# Altium schematic sheet A313_6.SchDoc
size 817 x 513 mm
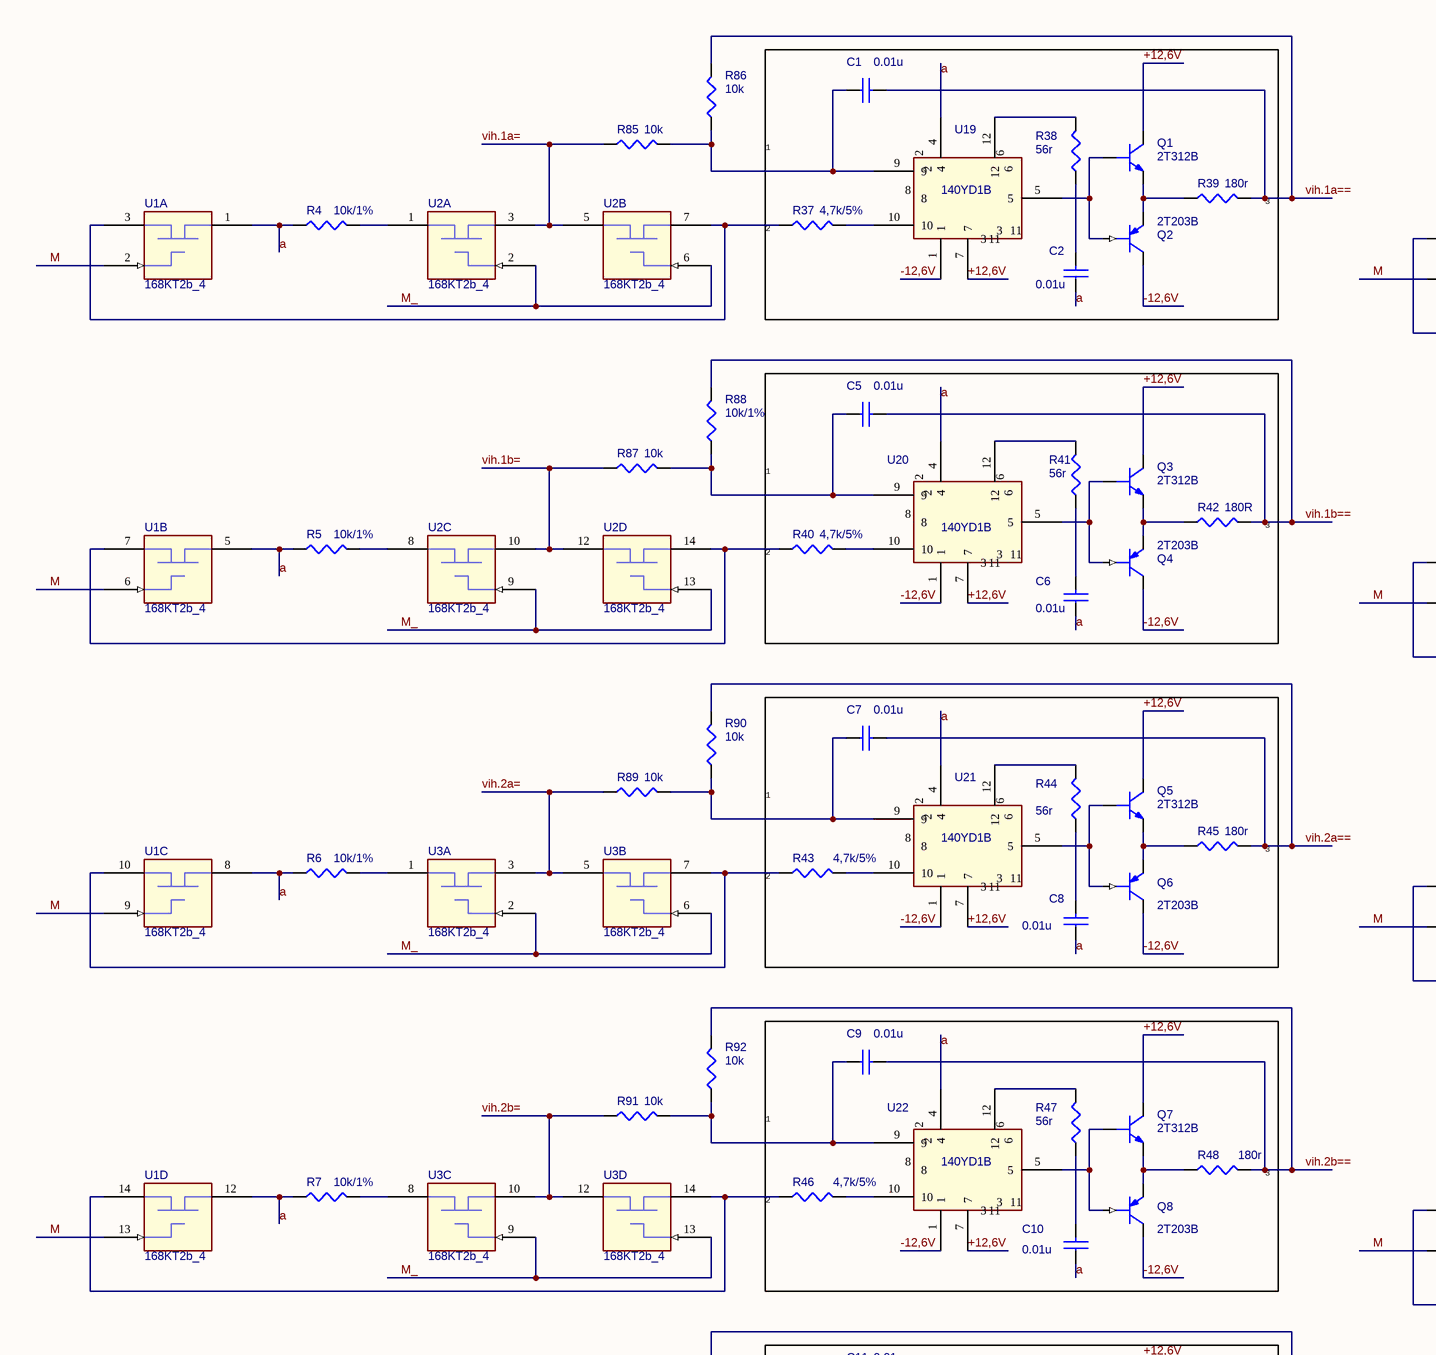
[diagram p0: A313_6.SchDoc, top left]
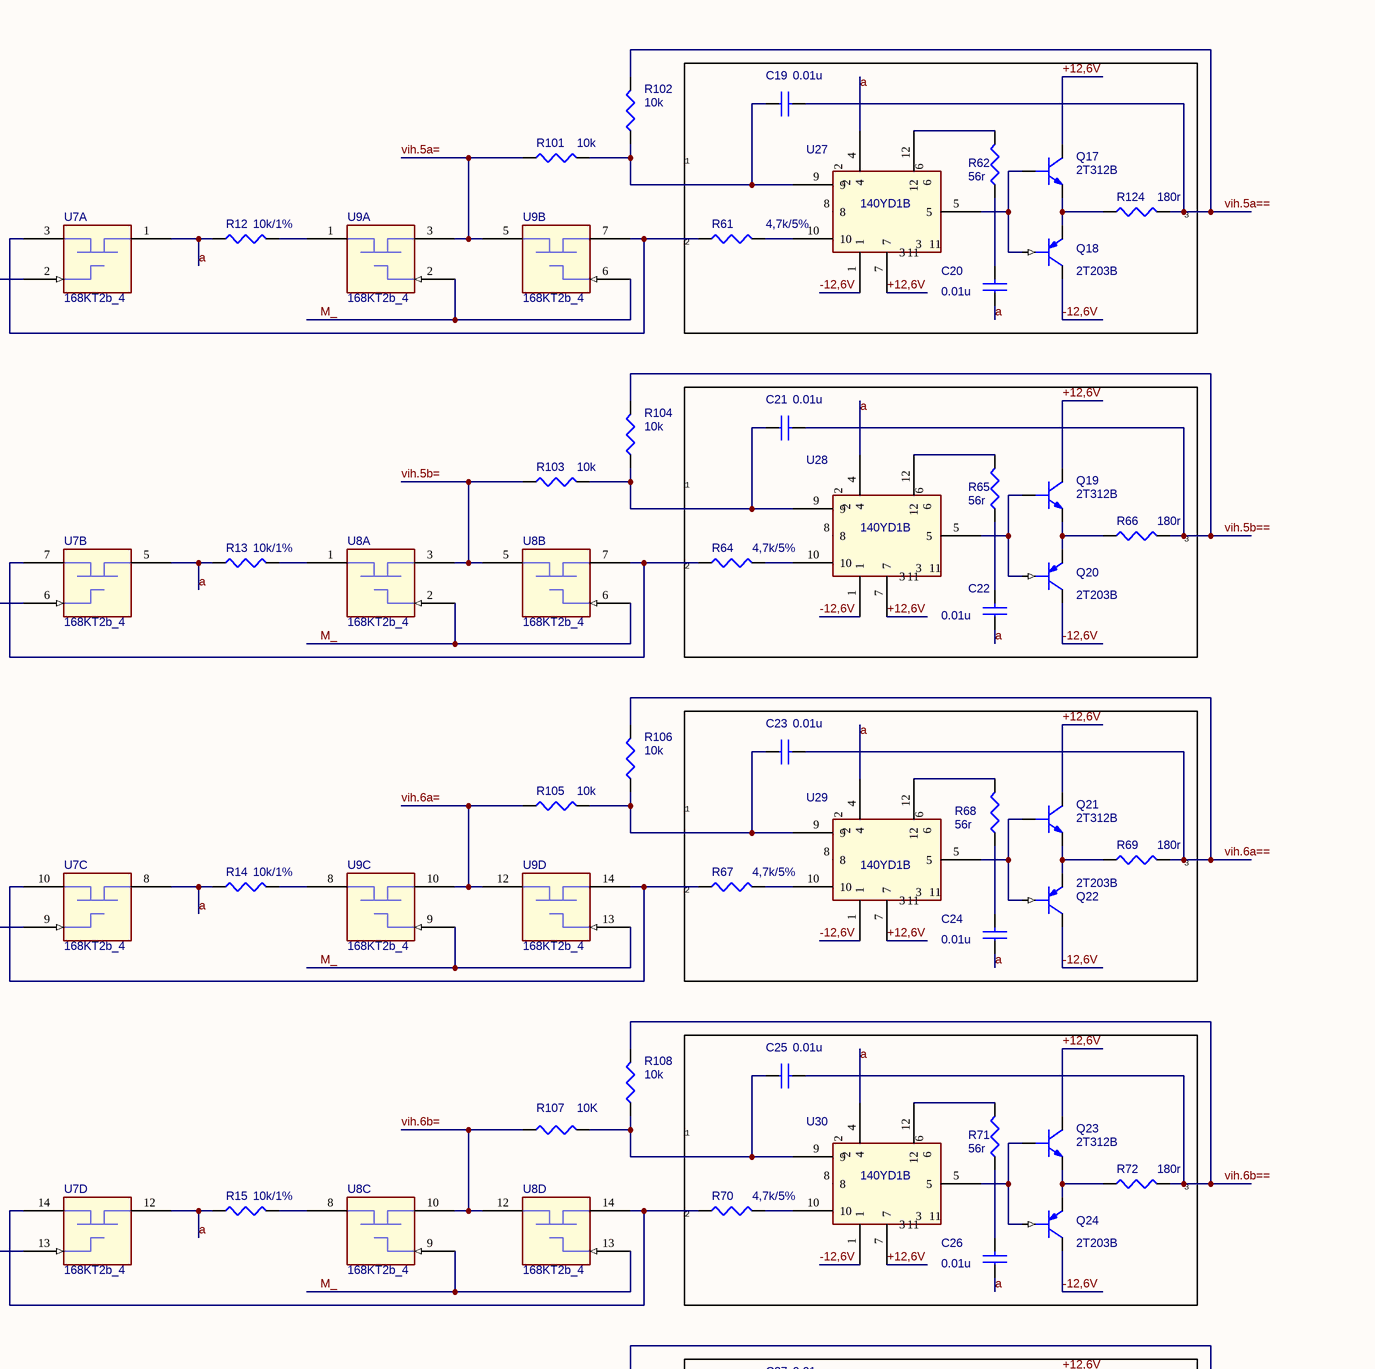
[diagram p1: A313_6.SchDoc, top middle]
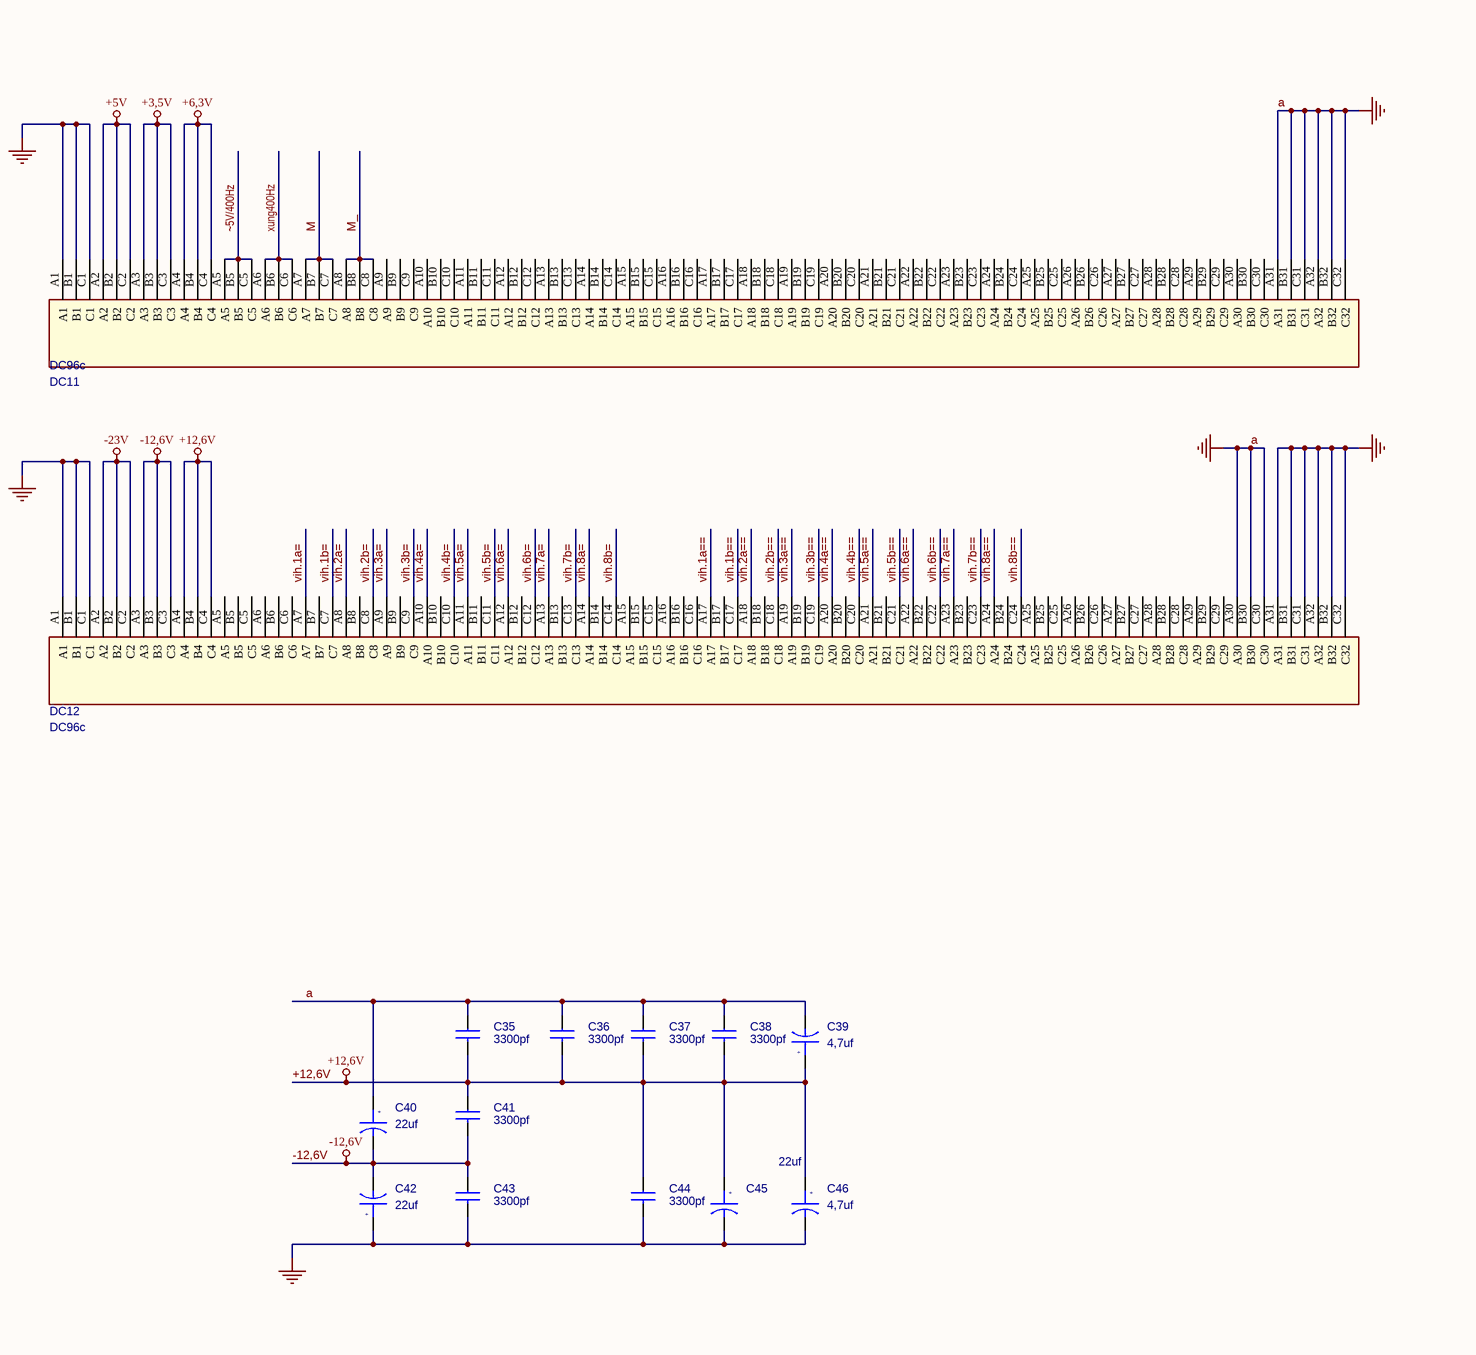
[diagram p2: A313_6.SchDoc, top right]
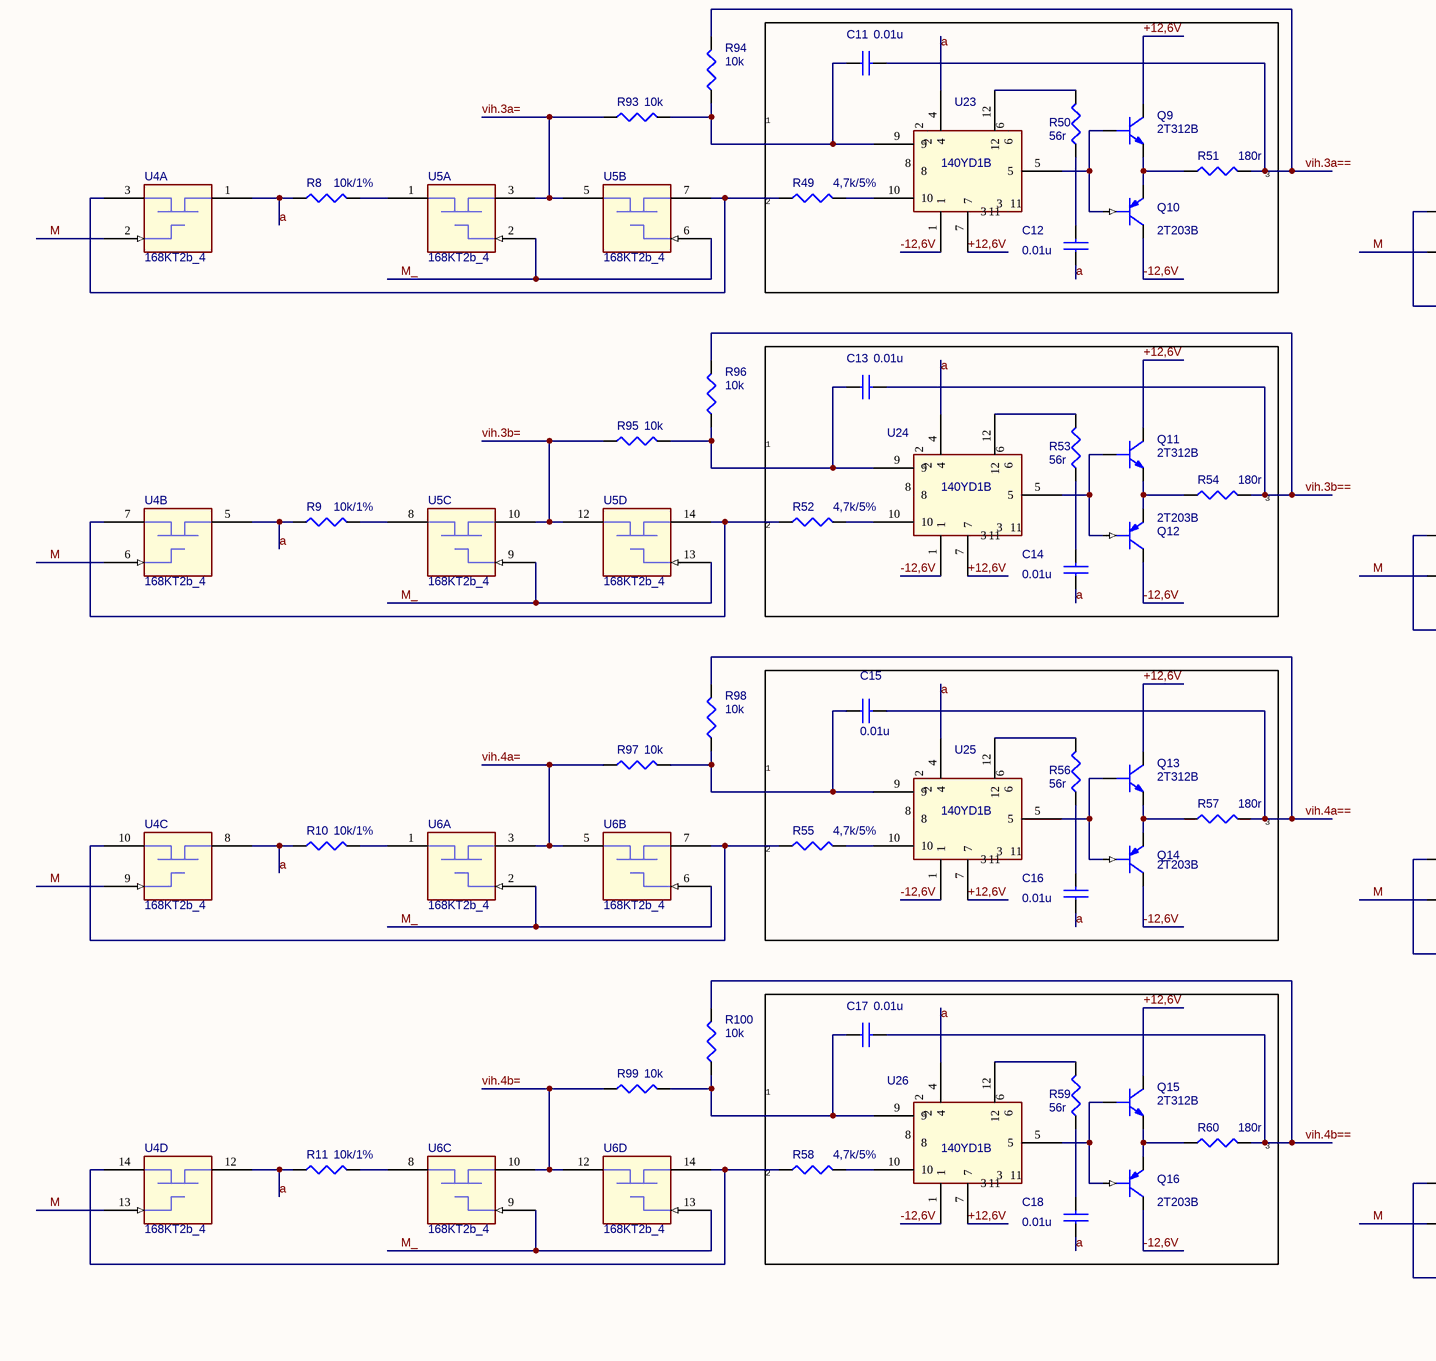
[diagram p3: A313_6.SchDoc, bottom left]
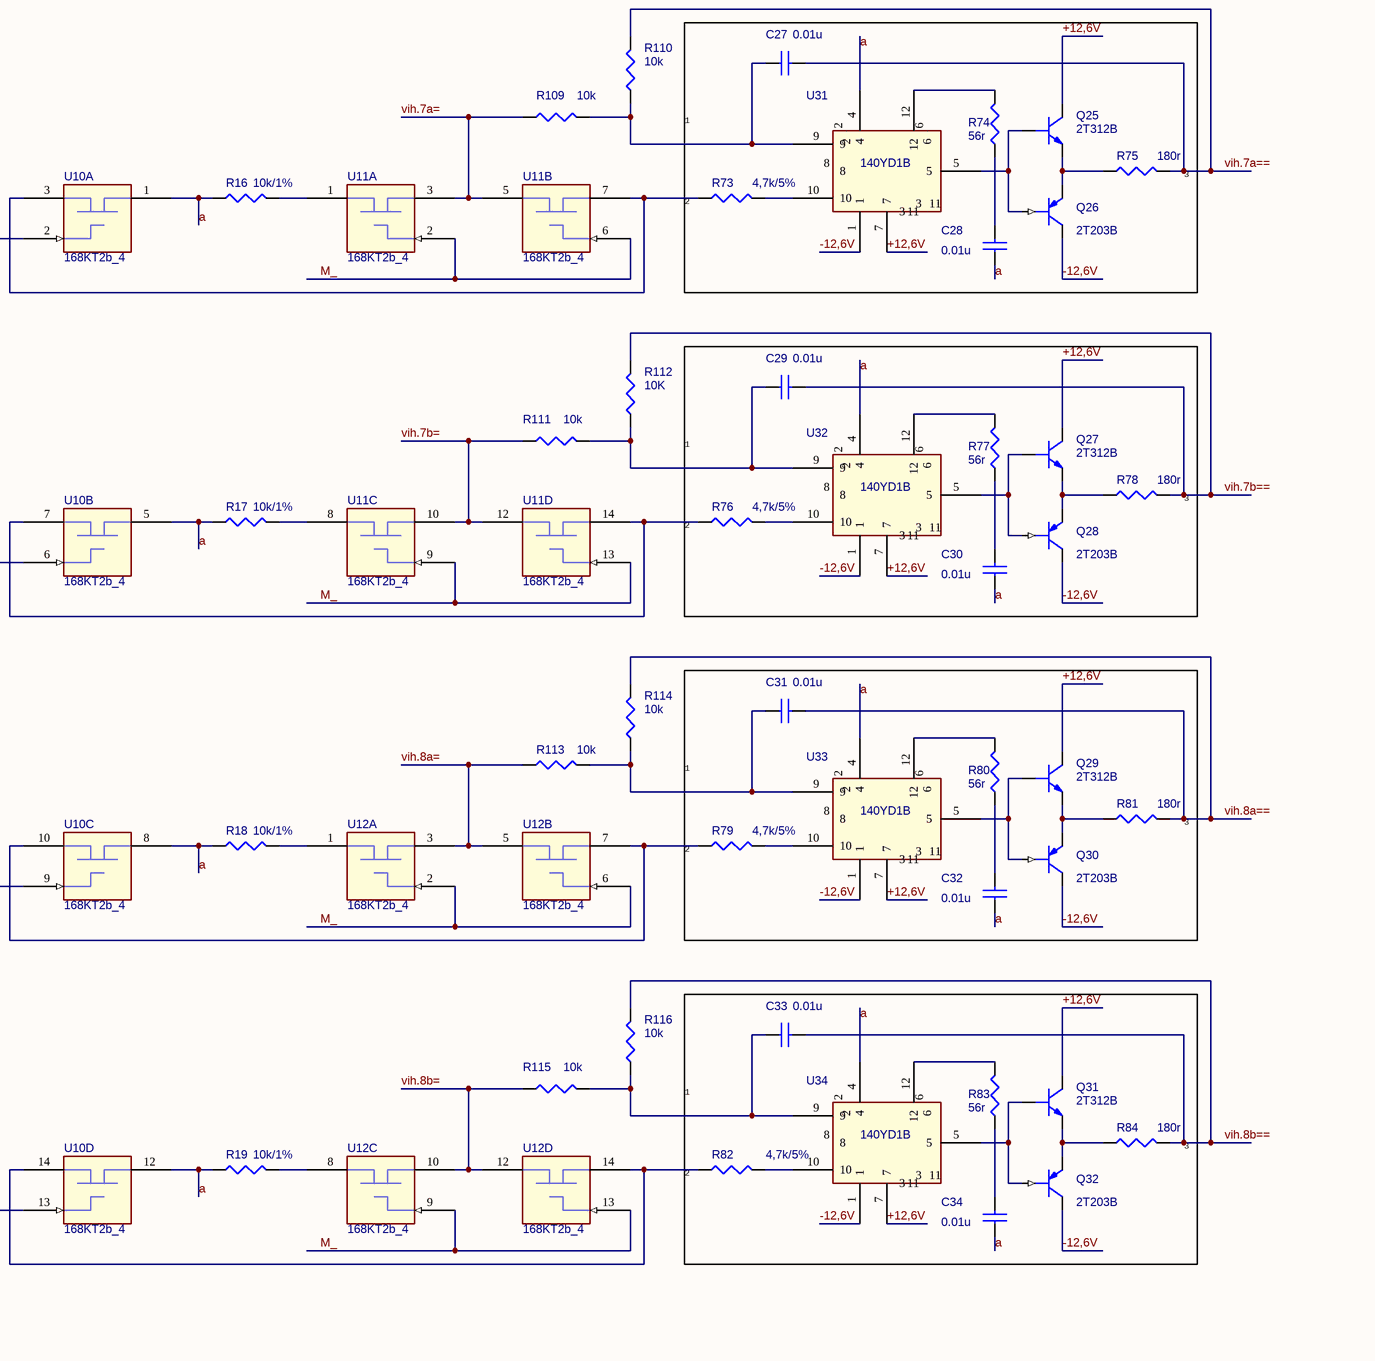
[diagram p4: A313_6.SchDoc, bottom middle]
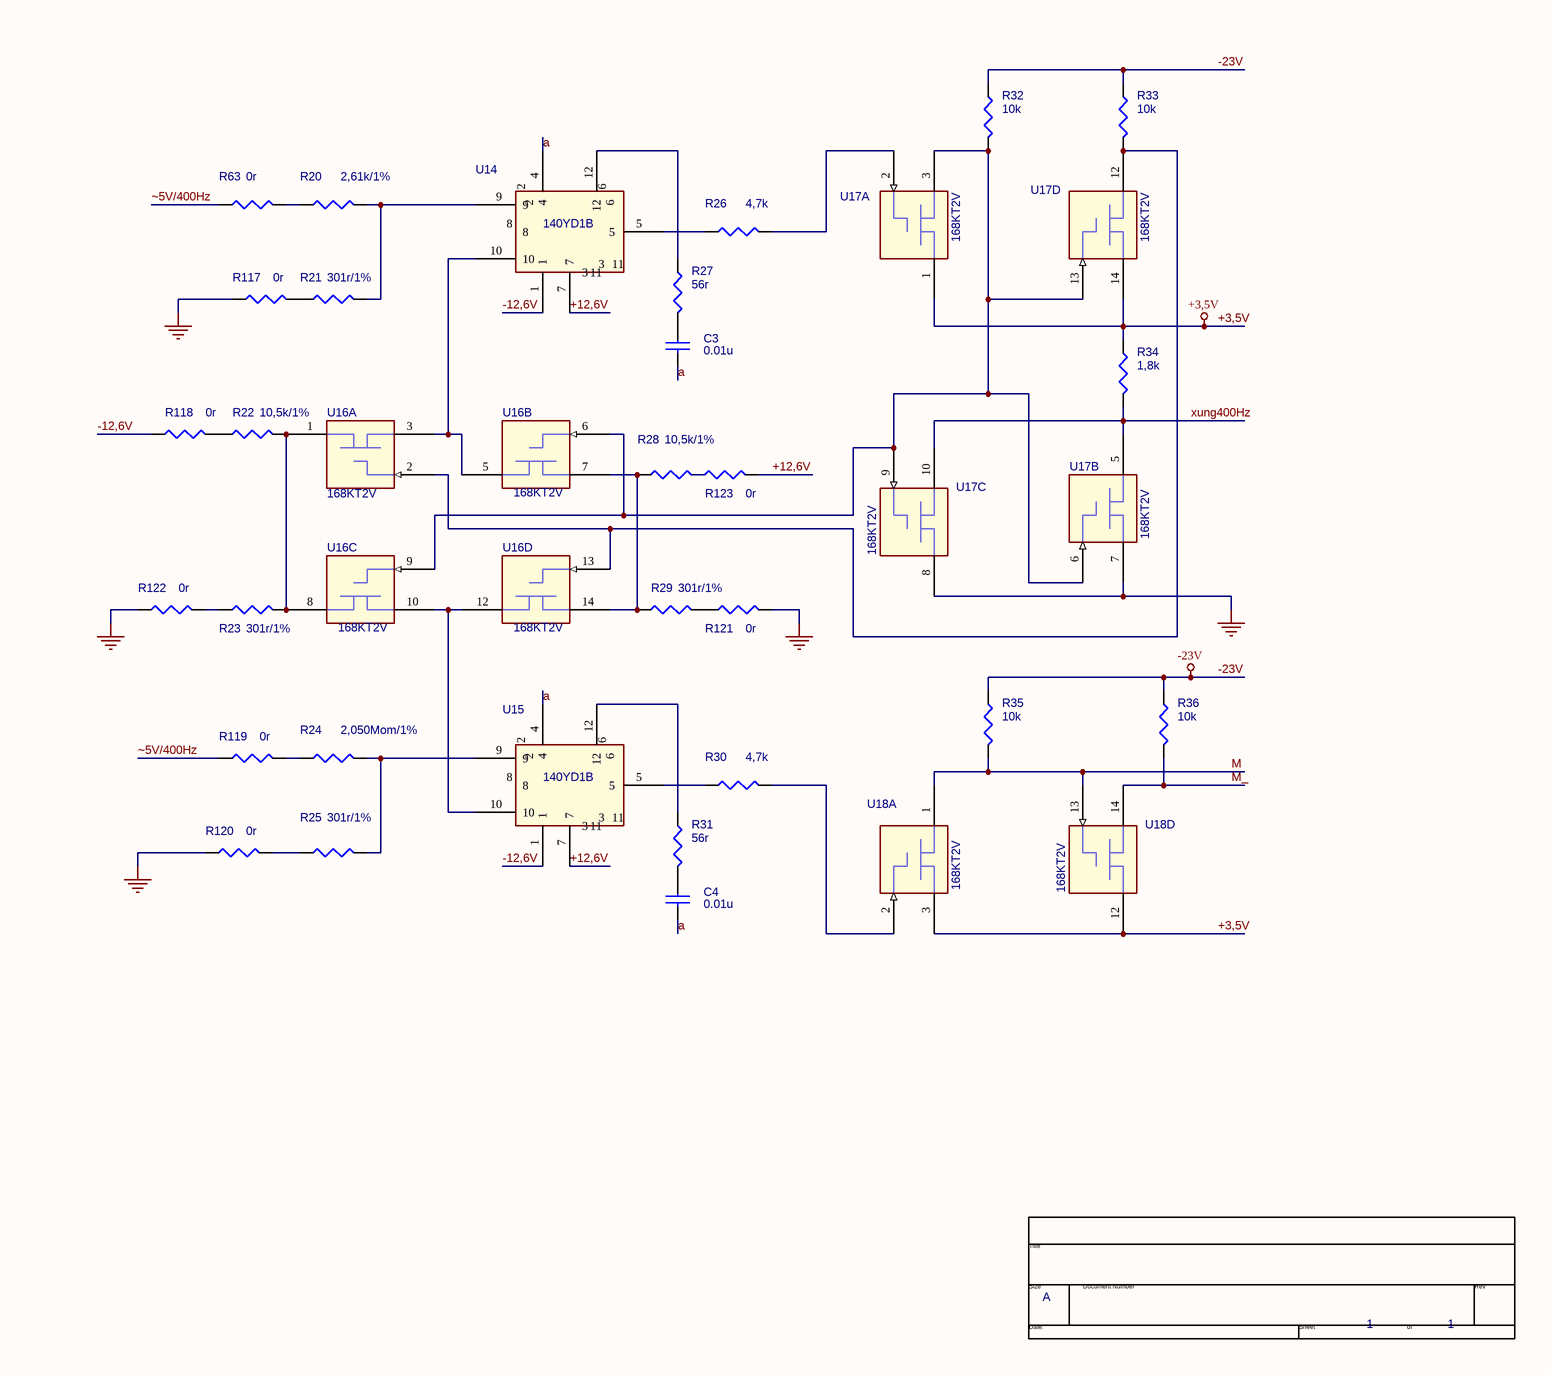
[diagram p5: A313_6.SchDoc, bottom right]

## Parts
(Parts that share a designator on the sheet are numbered #1, #2 ... from top to bottom, then left to right.)
*  Page Size: A  Page Number: 1  (hidden comment: TitleBlock0)  (graphical)
C1  0.01u  [0805]
C2  0.01u  [0805]
C3  0.01u  [0805]
C4  0.01u  [0805]
C5  0.01u  [0805]
C6  0.01u  [0805]
C7  0.01u  [0805]
C8  0.01u  [0805]
C9  0.01u  [0805]
C10  0.01u  [0805]
C11  0.01u  [0805]
C12  0.01u  [0805]
C13  0.01u  [0805]
C14  0.01u  [0805]
C15  0.01u  [0805]
C16  0.01u  [0805]
C17  0.01u  [0805]
C18  0.01u  [0805]
C19  0.01u  [0805]
C20  0.01u  [0805]
C21  0.01u  [0805]
C22  0.01u  [0805]
C23  0.01u  [0805]
C24  0.01u  [0805]
C25  0.01u  [0805]
C26  0.01u  [0805]
C27  0.01u  [0805]
C28  0.01u  [0805]
C29  0.01u  [0805]
C30  0.01u  [0805]
C31  0.01u  [0805]
C32  0.01u  [0805]
C33  0.01u  [0805]
C34  0.01u  [0805]
C35  3300pf  [0805]
C36  3300pf  [0805]
C37  3300pf  [0805]
C38  3300pf  [0805]
C39  4,7uf  [c4,7uf]
C40  22uf  [c22uf]
C41  3300pf  [0805]
C42  22uf  [c22uf]
C43  3300pf  [0805]
C44  3300pf  [0805]
C45  22uf  [c22uf]
C46  4,7uf  [c4,7uf]
DC11  DC96c  [DC96]
DC12  DC96c  [DC96]
Q1  2T312B  [tzt203g]
Q2  2T203B  [tzt203g]
Q3  2T312B  [tzt203g]
Q4  2T203B  [tzt203g]
Q5  2T312B  [tzt203g]
Q6  2T203B  [tzt203g]
Q7  2T312B  [tzt203g]
Q8  2T203B  [tzt203g]
Q9  2T312B  [tzt203g]
Q10  2T203B  [tzt203g]
Q11  2T312B  [tzt203g]
Q12  2T203B  [tzt203g]
Q13  2T312B  [tzt203g]
Q14  2T203B  [tzt203g]
Q15  2T312B  [tzt203g]
Q16  2T203B  [tzt203g]
Q17  2T312B  [tzt203g]
Q18  2T203B  [tzt203g]
Q19  2T312B  [tzt203g]
Q20  2T203B  [tzt203g]
Q21  2T312B  [tzt203g]
Q22  2T203B  [tzt203g]
Q23  2T312B  [tzt203g]
Q24  2T203B  [tzt203g]
Q25  2T312B  [tzt203g]
Q26  2T203B  [tzt203g]
Q27  2T312B  [tzt203g]
Q28  2T203B  [tzt203g]
Q29  2T312B  [tzt203g]
Q30  2T203B  [tzt203g]
Q31  2T312B  [tzt203g]
Q32  2T203B  [tzt203g]
R4  10k/1%  [r0805]
R5  10k/1%  [r0805]
R6  10k/1%  [r0805]
R7  10k/1%  [r0805]
R8  10k/1%  [r0805]
R9  10k/1%  [r0805]
R10  10k/1%  [r0805]
R11  10k/1%  [r0805]
R12  10k/1%  [r0805]
R13  10k/1%  [r0805]
R14  10k/1%  [r0805]
R15  10k/1%  [r0805]
R16  10k/1%  [r0805]
R17  10k/1%  [r0805]
R18  10k/1%  [r0805]
R19  10k/1%  [r0805]
R20  2,61k/1%  [r0805]
R21  301r/1%  [r0805]
R22  10,5k/1%  [r0805]
R23  301r/1%  [r0805]
R24  2,050Mom/1%  [r0805]
R25  301r/1%  [r0805]
R26  4,7k  [r0805]
R27  56r  [r0805]
R28  10,5k/1%  [r0805]
R29  301r/1%  [r0805]
R30  4,7k  [r0805]
R31  56r  [r0805]
R32  10k  [r0805]
R33  10k  [r0805]
R34  1,8k  [r0805]
R35  10k  [r0805]
R36  10k  [r0805]
R37  4,7k/5%  [r0805]
R38  56r  [r0805]
R39  180r  [r0805]
R40  4,7k/5%  [r0805]
R41  56r  [r0805]
R42  180R  [r0805]
R43  4,7k/5%  [r0805]
R44  56r  [r0805]
R45  180r  [r0805]
R46  4,7k/5%  [r0805]
R47  56r  [r0805]
R48  180r  [r0805]
R49  4,7k/5%  [r0805]
R50  56r  [r0805]
R51  180r  [r0805]
R52  4,7k/5%  [r0805]
R53  56r  [r0805]
R54  180r  [r0805]
R55  4,7k/5%  [r0805]
R56  56r  [r0805]
R57  180r  [r0805]
R58  4,7k/5%  [r0805]
R59  56r  [r0805]
R60  180r  [r0805]
R61  4,7k/5%  [r0805]
R62  56r  [r0805]
R63  0r  [r0805]
R64  4,7k/5%  [r0805]
R65  56r  [r0805]
R66  180r  [r0805]
R67  4,7k/5%  [r0805]
R68  56r  [r0805]
R69  180r  [r0805]
R70  4,7k/5%  [r0805]
R71  56r  [r0805]
R72  180r  [r0805]
R73  4,7k/5%  [r0805]
R74  56r  [r0805]
R75  180r  [r0805]
R76  4,7k/5%  [r0805]
R77  56r  [r0805]
R78  180r  [r0805]
R79  4,7k/5%  [r0805]
R80  56r  [r0805]
R81  180r  [r0805]
R82  4,7k/5%  [r0805]
R83  56r  [r0805]
R84  180r  [r0805]
R85  10k  [r0805]
R86  10k  [r0805]
R87  10k  [r0805]
R88  10k/1%  [r0805]
R89  10k  [r0805]
R90  10k  [r0805]
R91  10k  [r0805]
R92  10k  [r0805]
R93  10k  [r0805]
R94  10k  [r0805]
R95  10k  [r0805]
R96  10k  [r0805]
R97  10k  [r0805]
R98  10k  [r0805]
R99  10k  [r0805]
R100  10k  [r0805]
R101  10k  [r0805]
R102  10k  [r0805]
R103  10k  [r0805]
R104  10k  [r0805]
R105  10k  [r0805]
R106  10k  [r0805]
R107  10K  [r0805]
R108  10k  [r0805]
R109  10k  [r0805]
R110  10k  [r0805]
R111  10k  [r0805]
R112  10K  [r0805]
R113  10k  [r0805]
R114  10k  [r0805]
R115  10k  [r0805]
R116  10k  [r0805]
R117  0r  [r0805]
R118  0r  [r0805]
R119  0r  [r0805]
R120  0r  [r0805]
R121  0r  [r0805]
R122  0r  [r0805]
R123  0r  [r0805]
R124  180r  [r0805]
U1#1  168KT2b_4  [168KT2B-1]  (part A of 4)
U1#2  168KT2b_4  [168KT2B-1]  (parts B,C,D of 4)
U2#1  168KT2b_4  [168KT2B-1]  (part A of 4)
U2#2  168KT2b_4  [168KT2B-1]  (parts B,C,D of 4)
U3  168KT2b_4  [168KT2B-1]  (parts A,B,C,D of 4)
U4  168KT2b_4  [168KT2B-1]  (parts A,B,C,D of 4)
U5  168KT2b_4  [168KT2B-1]  (parts A,B,C,D of 4)
U6  168KT2b_4  [168KT2B-1]  (parts A,B,C,D of 4)
U7  168KT2b_4  [168KT2B-1]  (parts A,B,C,D of 4)
U8#1  168KT2b_4  [168KT2B-1]  (parts A,B,D of 4)
U8#2  168KT2b_4  [168KT2B-1]  (part C of 4)
U9  168KT2b_4  [168KT2B-1]  (parts A,B,C,D of 4)
U10  168KT2b_4  [168KT2B-1]  (parts A,B,C,D of 4)
U11  168KT2b_4  [168KT2B-1]  (parts A,B,C,D of 4)
U12#1  168KT2b_4  [168KT2B-1]  (part A of 4)
U12#2  168KT2b_4  [168KT2B-1]  (parts B,C,D of 4)
U14  140YD1B  [140YD]
U15  140YD1B  [140YD]
U16#1  168KT2V  [168KT2B-1]  (part B of 4)
U16#2  168KT2V  [168KT2B-1]  (part A of 4)
U16#3  168KT2V  [168KT2B-1]  (parts C,D of 4)
U17#1  168KT2V  [168KT2B-1]  (parts A,B,D of 4)
U17#2  168KT2V  [168KT2B-1]  (part C of 4)
U18  168KT2V  [168KT2B-1]  (parts A,D of 4)
U19  140YD1B  [140YD]
U20  140YD1B  [140YD]
U21  140YD1B  [140YD]
U22  140YD1B  [140YD]
U23  140YD1B  [140YD]
U24  140YD1B  [140YD]
U25  140YD1B  [140YD]
U26  140YD1B  [140YD]
U27  140YD1B  [140YD]
U28  140YD1B  [140YD]
U29  140YD1B  [140YD]
U30  140YD1B  [140YD]
U31  140YD1B  [140YD]
U32  140YD1B  [140YD]
U33  140YD1B  [140YD]
U34  140YD1B  [140YD]

## Nets
+3,5V: DC11.A3 DC11.B3 DC11.C3 R34.1 U16#1.11(+3,5V) U16#2.11(+3,5V) U16#3.11(+3,5V) U17#1.1(A) U17#1.11(+3,5V) U17#1.14(B) U17#2.11(+3,5V) U18.3(B) U18.11(+3,5V) U18.12(A)
+5V: DC11.A2 DC11.B2 DC11.C2
+6,3V: DC11.A4 DC11.B4 DC11.C4 U1#1.11(+6,3V) U1#2.11(+6,3V) U2#1.11(+6,3V) U2#2.11(+6,3V) U3.11(+6,3V) U4.11(+6,3V) U5.11(+6,3V) U6.11(+6,3V) U7.11(+6,3V) U8#1.11(+6,3V) U8#2.11(+6,3V) U9.11(+6,3V) U10.11(+6,3V) U11.11(+6,3V) U12#1.11(+6,3V) U12#2.11(+6,3V)
+12,6V: C35.2 C36.2 C37.2 C38.2 C39.1 C41.1 C44.1 C45.1 C46.1 DC12.A4 DC12.B4 DC12.C4 Q1.2(C) Q3.2(C) Q5.2(C) Q7.2(C) Q9.2(C) Q11.2(C) Q13.2(C) Q15.2(C) Q17.2(C) Q19.2(C) Q21.2(C) Q23.2(C) Q25.2(C) Q27.2(C) Q29.2(C) Q31.2(C) R123.2 U14.7 U15.7 U19.7 U20.7 U21.7 U22.7 U23.7 U24.7 U25.7 U26.7 U27.7 U28.7 U29.7 U30.7 U31.7 U32.7 U33.7 U34.7
-12,6V: C40.2 C41.2 C42.2 C43.1 DC12.A3 DC12.B3 DC12.C3 Q2.3(COLLECTOR) Q4.3(COLLECTOR) Q6.3(COLLECTOR) Q8.3(COLLECTOR) Q10.3(COLLECTOR) Q12.3(COLLECTOR) Q14.3(COLLECTOR) Q16.3(COLLECTOR) Q18.3(COLLECTOR) Q20.3(COLLECTOR) Q22.3(COLLECTOR) Q24.3(COLLECTOR) Q26.3(COLLECTOR) Q28.3(COLLECTOR) Q30.3(COLLECTOR) Q32.3(COLLECTOR) R118.1 U14.1 U15.1 U19.1 U20.1 U21.1 U22.1 U23.1 U24.1 U25.1 U26.1 U27.1 U28.1 U29.1 U30.1 U31.1 U32.1 U33.1 U34.1
-23V: DC12.A2 DC12.B2 DC12.C2 R32.1 R33.1 R35.1 R36.1
a: C2.1 C3.2 C4.2 C6.1 C8.1 C10.1 C12.1 C14.1 C16.1 C18.1 C20.1 C22.1 C24.1 C26.1 C28.1 C30.1 C32.1 C34.1 C35.1 C36.1 C37.1 C38.1 C39.2 C40.1 C42.1 C43.2 C44.2 C45.2 C46.2 DC11.A1 DC11.A31 DC11.A32 DC11.B1 DC11.B31 DC11.B32 DC11.C1 DC11.C31 DC11.C32 DC12.A1 DC12.A30 DC12.A31 DC12.A32 DC12.B1 DC12.B30 DC12.B31 DC12.B32 DC12.C1 DC12.C30 DC12.C31 DC12.C32 R4.1 R5.1 R6.1 R7.1 R8.1 R9.1 R10.1 R11.1 R12.1 R13.1 R14.1 R15.1 R16.1 R17.1 R18.1 R19.1 R117.1 R120.1 R121.2 R122.1 U1#1.1(A) U1#2.5(A) U1#2.8(A) U1#2.12(A) U4.1(A) U4.5(A) U4.8(A) U4.12(A) U7.1(A) U7.5(A) U7.8(A) U7.12(A) U10.1(A) U10.5(A) U10.8(A) U10.12(A) U14.4 U15.4 U17#1.7(B) U17#2.8(A) U19.4 U20.4 U21.4 U22.4 U23.4 U24.4 U25.4 U26.4 U27.4 U28.4 U29.4 U30.4 U31.4 U32.4 U33.4 U34.4  [also labelled GND]
M: DC11.A7 DC11.B7 DC11.C7 R35.2 U1#1.2(C) U1#2.6(C) U1#2.9(C) U1#2.13(C) U4.2(C) U4.6(C) U4.9(C) U4.13(C) U7.2(C) U7.6(C) U7.9(C) U7.13(C) U10.2(C) U10.6(C) U10.9(C) U10.13(C) U18.1(A) U18.13(C)
M_: DC11.A8 DC11.B8 DC11.C8 R36.2 U2#1.2(C) U2#2.6(C) U2#2.9(C) U2#2.13(C) U3.2(C) U3.6(C) U3.9(C) U3.13(C) U5.2(C) U5.6(C) U5.9(C) U5.13(C) U6.2(C) U6.6(C) U6.9(C) U6.13(C) U8#1.2(C) U8#1.6(C) U8#1.13(C) U8#2.9(C) U9.2(C) U9.6(C) U9.9(C) U9.13(C) U11.2(C) U11.6(C) U11.9(C) U11.13(C) U12#1.2(C) U12#2.6(C) U12#2.9(C) U12#2.13(C) U18.14(B)
vih.1a=: DC12.A7 R85.1 U2#1.3(B) U2#2.5(A)
vih.1a==: C1.2 DC12.A17 R39.2 R86.2
vih.1b=: DC12.C7 R87.1 U2#2.10(B) U2#2.12(A)
vih.1b==: C5.2 DC12.C17 R42.2 R88.2
vih.2a=: DC12.A8 R89.1 U3.3(B) U3.5(A)
vih.2a==: C7.2 DC12.A18 R45.2 R90.2
vih.2b=: DC12.C8 R91.1 U3.10(B) U3.12(A)
vih.2b==: C9.2 DC12.C18 R48.2 R92.2
vih.3a=: DC12.A9 R93.1 U5.3(B) U5.5(A)
vih.3a==: C11.2 DC12.A19 R51.2 R94.2
vih.3b=: DC12.C9 R95.1 U5.10(B) U5.12(A)
vih.3b==: C13.2 DC12.C19 R54.2 R96.2
vih.4a=: DC12.A10 R97.1 U6.3(B) U6.5(A)
vih.4a==: C15.2 DC12.A20 R57.2 R98.2
vih.4b=: DC12.C10 R99.1 U6.10(B) U6.12(A)
vih.4b==: C17.2 DC12.C20 R60.2 R100.2
vih.5a=: DC12.A11 R101.1 U9.3(B) U9.5(A)
vih.5a==: C19.2 DC12.A21 R102.2 R124.2
vih.5b=: DC12.C11 R103.1 U8#1.3(B) U8#1.5(A)
vih.5b==: C21.2 DC12.C21 R66.2 R104.2
vih.6a=: DC12.A12 R105.1 U9.10(B) U9.12(A)
vih.6a==: C23.2 DC12.A22 R69.2 R106.2
vih.6b=: DC12.C12 R107.1 U8#1.12(A) U8#2.10(B)
vih.6b==: C25.2 DC12.C22 R72.2 R108.2
vih.7a=: DC12.A13 R109.1 U11.3(B) U11.5(A)
vih.7a==: C27.2 DC12.A23 R75.2 R110.2
vih.7b=: DC12.C13 R111.1 U11.10(B) U11.12(A)
vih.7b==: C29.2 DC12.C23 R78.2 R112.2
vih.8a=: DC12.A14 R113.1 U12#1.3(B) U12#2.5(A)
vih.8a==: C31.2 DC12.A24 R81.2 R114.2
vih.8b=: DC12.C14 R115.1 U12#2.10(B) U12#2.12(A)
vih.8b==: C33.2 DC12.C24 R84.2 R116.2
xung400Hz: DC11.A6 DC11.B6 DC11.C6 R34.2 U17#1.5(A) U17#2.10(B)
~5V/400Hz: DC11.A5 DC11.B5 DC11.C5 R63.1 R119.1
NetC1_1: C1.1 R85.2 R86.1 U19.9
NetC2_2: C2.2 R38.1
NetC3_1: C3.1 R27.2
NetC4_1: C4.1 R31.2
NetC5_1: C5.1 R87.2 R88.1 U20.9
NetC6_2: C6.2 R41.1
NetC7_1: C7.1 R89.2 R90.1 U21.9
NetC8_2: C8.2 R44.1
NetC9_1: C9.1 R91.2 R92.1 U22.9
NetC10_2: C10.2 R47.1
NetC11_1: C11.1 R93.2 R94.1 U23.9
NetC12_2: C12.2 R50.1
NetC13_1: C13.1 R95.2 R96.1 U24.9
NetC14_2: C14.2 R53.1
NetC15_1: C15.1 R97.2 R98.1 U25.9
NetC16_2: C16.2 R56.1
NetC17_1: C17.1 R99.2 R100.1 U26.9
NetC18_2: C18.2 R59.1
NetC19_1: C19.1 R101.2 R102.1 U27.9
NetC20_2: C20.2 R62.1
NetC21_1: C21.1 R103.2 R104.1 U28.9
NetC22_2: C22.2 R65.1
NetC23_1: C23.1 R105.2 R106.1 U29.9
NetC24_2: C24.2 R68.1
NetC25_1: C25.1 R107.2 R108.1 U30.9
NetC26_2: C26.2 R71.1
NetC27_1: C27.1 R109.2 R110.1 U31.9
NetC28_2: C28.2 R74.1
NetC29_1: C29.1 R111.2 R112.1 U32.9
NetC30_2: C30.2 R77.1
NetC31_1: C31.1 R113.2 R114.1 U33.9
NetC32_2: C32.2 R80.1
NetC33_1: C33.1 R115.2 R116.1 U34.9
NetC34_2: C34.2 R83.1
NetQ1_1: Q1.1(B) Q2.2(BASE) U19.5
NetQ1_3: Q1.3(E) Q2.1(EMITTER) R39.1
NetQ3_1: Q3.1(B) Q4.2(BASE) U20.5
NetQ3_3: Q3.3(E) Q4.1(EMITTER) R42.1
NetQ5_1: Q5.1(B) Q6.2(BASE) U21.5
NetQ5_3: Q5.3(E) Q6.1(EMITTER) R45.1
NetQ7_1: Q7.1(B) Q8.2(BASE) U22.5
NetQ7_3: Q7.3(E) Q8.1(EMITTER) R48.1
NetQ9_1: Q9.1(B) Q10.2(BASE) U23.5
NetQ9_3: Q9.3(E) Q10.1(EMITTER) R51.1
NetQ11_1: Q11.1(B) Q12.2(BASE) U24.5
NetQ11_3: Q11.3(E) Q12.1(EMITTER) R54.1
NetQ13_1: Q13.1(B) Q14.2(BASE) U25.5
NetQ13_3: Q13.3(E) Q14.1(EMITTER) R57.1
NetQ15_1: Q15.1(B) Q16.2(BASE) U26.5
NetQ15_3: Q15.3(E) Q16.1(EMITTER) R60.1
NetQ17_1: Q17.1(B) Q18.2(BASE) U27.5
NetQ17_3: Q17.3(E) Q18.1(EMITTER) R124.1
NetQ19_1: Q19.1(B) Q20.2(BASE) U28.5
NetQ19_3: Q19.3(E) Q20.1(EMITTER) R66.1
NetQ21_1: Q21.1(B) Q22.2(BASE) U29.5
NetQ21_3: Q21.3(E) Q22.1(EMITTER) R69.1
NetQ23_1: Q23.1(B) Q24.2(BASE) U30.5
NetQ23_3: Q23.3(E) Q24.1(EMITTER) R72.1
NetQ25_1: Q25.1(B) Q26.2(BASE) U31.5
NetQ25_3: Q25.3(E) Q26.1(EMITTER) R75.1
NetQ27_1: Q27.1(B) Q28.2(BASE) U32.5
NetQ27_3: Q27.3(E) Q28.1(EMITTER) R78.1
NetQ29_1: Q29.1(B) Q30.2(BASE) U33.5
NetQ29_3: Q29.3(E) Q30.1(EMITTER) R81.1
NetQ31_1: Q31.1(B) Q32.2(BASE) U34.5
NetQ31_3: Q31.3(E) Q32.1(EMITTER) R84.1
NetR4_2: R4.2 U2#1.1(A)
NetR5_2: R5.2 U2#2.8(A)
NetR6_2: R6.2 U3.1(A)
NetR7_2: R7.2 U3.8(A)
NetR8_2: R8.2 U5.1(A)
NetR9_2: R9.2 U5.8(A)
NetR10_2: R10.2 U6.1(A)
NetR11_2: R11.2 U6.8(A)
NetR12_2: R12.2 U9.1(A)
NetR13_2: R13.2 U8#1.1(A)
NetR14_2: R14.2 U9.8(A)
NetR15_2: R15.2 U8#2.8(A)
NetR16_2: R16.2 U11.1(A)
NetR17_2: R17.2 U11.8(A)
NetR18_2: R18.2 U12#1.1(A)
NetR19_2: R19.2 U12#2.8(A)
NetR20_1: R20.1 R63.2
NetR20_2: R20.2 R21.2 U14.9
NetR21_1: R21.1 R117.2
NetR22_1: R22.1 R118.2
NetR22_2: R22.2 R23.2 U16#2.1(A) U16#3.8(A)
NetR23_1: R23.1 R122.2
NetR24_1: R24.1 R119.2
NetR24_2: R24.2 R25.2 U15.9
NetR25_1: R25.1 R120.2
NetR26_1: R26.1 U14.5
NetR26_2: R26.2 U17#1.2(C)
NetR27_1: R27.1 U14.12
NetR28_1: R28.1 R29.1 U16#1.7(B) U16#3.14(B)
NetR28_2: R28.2 R123.1
NetR29_2: R29.2 R121.1
NetR30_1: R30.1 U15.5
NetR30_2: R30.2 U18.2(C)
NetR31_1: R31.1 U15.12
NetR32_2: R32.2 U16#1.6(C) U16#3.9(C) U17#1.3(B) U17#1.6(C) U17#1.13(C) U17#2.9(C)
NetR33_2: R33.2 U16#2.2(C) U16#3.13(C) U17#1.12(A)
NetR37_1: R37.1 U1#1.3(B) U2#2.7(B)
NetR37_2: R37.2 U19.10
NetR38_2: R38.2 U19.12
NetR40_1: R40.1 U1#2.7(B) U2#2.14(B)
NetR40_2: R40.2 U20.10
NetR41_2: R41.2 U20.12
NetR43_1: R43.1 U1#2.10(B) U3.7(B)
NetR43_2: R43.2 U21.10
NetR44_2: R44.2 U21.12
NetR46_1: R46.1 U1#2.14(B) U3.14(B)
NetR46_2: R46.2 U22.10
NetR47_2: R47.2 U22.12
NetR49_1: R49.1 U4.3(B) U5.7(B)
NetR49_2: R49.2 U23.10
NetR50_2: R50.2 U23.12
NetR52_1: R52.1 U4.7(B) U5.14(B)
NetR52_2: R52.2 U24.10
NetR53_2: R53.2 U24.12
NetR55_1: R55.1 U4.10(B) U6.7(B)
NetR55_2: R55.2 U25.10
NetR56_2: R56.2 U25.12
NetR58_1: R58.1 U4.14(B) U6.14(B)
NetR58_2: R58.2 U26.10
NetR59_2: R59.2 U26.12
NetR61_1: R61.1 U7.3(B) U9.7(B)
NetR61_2: R61.2 U27.10
NetR62_2: R62.2 U27.12
NetR64_1: R64.1 U7.7(B) U8#1.7(B)
NetR64_2: R64.2 U28.10
NetR65_2: R65.2 U28.12
NetR67_1: R67.1 U7.10(B) U9.14(B)
NetR67_2: R67.2 U29.10
NetR68_2: R68.2 U29.12
NetR70_1: R70.1 U7.14(B) U8#1.14(B)
NetR70_2: R70.2 U30.10
NetR71_2: R71.2 U30.12
NetR73_1: R73.1 U10.3(B) U11.7(B)
NetR73_2: R73.2 U31.10
NetR74_2: R74.2 U31.12
NetR76_1: R76.1 U10.7(B) U11.14(B)
NetR76_2: R76.2 U32.10
NetR77_2: R77.2 U32.12
NetR79_1: R79.1 U10.10(B) U12#2.7(B)
NetR79_2: R79.2 U33.10
NetR80_2: R80.2 U33.12
NetR82_1: R82.1 U10.14(B) U12#2.14(B)
NetR82_2: R82.2 U34.10
NetR83_2: R83.2 U34.12
NetU14_10: U14.10 U16#1.5(A) U16#2.3(B)
NetU15_10: U15.10 U16#3.10(B) U16#3.12(A)

Not connected (* = marked no-connect by the designer): DC11 A9 A10 A11 A12 A13 A14 A15 A16 A17 A18 A19 A20 A21 A22 A23 A24 A25 A26 A27 A28 A29 A30 B9 B10 B11 B12 B13 B14 B15 B16 B17 B18 B19 B20 B21 B22 B23 B24 B25 B26 B27 B28 B29 B30 C9 C10 C11 C12 C13 C14 C15 C16 C17 C18 C19 C20 C21 C22 C23 C24 C25 C26 C27 C28 C29 C30; DC12 A5 A6 A15 A16 A25 A26 A27 A28 A29 B5 B6 B7 B8 B9 B10 B11 B12 B13 B14 B15 B16 B17 B18 B19 B20 B21 B22 B23 B24 B25 B26 B27 B28 B29 C5 C6 C15 C16 C25 C26 C27 C28 C29; U14 2 3 6 8 11; U15 2 3 6 8 11; U19 2 3 6 8 11; U20 2 3 6 8 11; U21 2 3 6 8 11; U22 2 3 6 8 11; U23 2 3 6 8 11; U24 2 3 6 8 11; U25 2 3 6 8 11; U26 2 3 6 8 11; U27 2 3 6 8 11; U28 2 3 6 8 11; U29 2 3 6 8 11; U30 2 3 6 8 11; U31 2 3 6 8 11; U32 2 3 6 8 11; U33 2 3 6 8 11; U34 2 3 6 8 11

## Notes on the sheet
- 1
- (near R39) 3
- (near R124) 3
- (near R37) 2
- (near R61) 2
- (near R40) 2
- (near R42) 3
- (near R66) 3
- (near R64) 2
- (near R43) 2
- (near R45) 3
- (near R67) 2
- (near R69) 3
- (near R46) 2
- (near R48) 3
- (near R70) 2
- (near R72) 3
- (near R51) 3
- (near R49) 2
- (near R73) 2
- (near R75) 3
- (near R54) 3
- (near R78) 3
- (near R52) 2
- (near R76) 2
- (near R55) 2
- (near R57) 3
- (near R81) 3
- (near R79) 2
- (near R58) 2
- (near R60) 3
- (near R82) 2
- (near R84) 3
- (in symbol CAP POL) +
- (in symbol TitleBlock0) Title; Size; Document Number; Rev; Date:; Sheet; of

## Library data of the parts
C1-C38 C41 C43 C44 = CAP NP
C39 C40 C42 C45 C46 = CAP POL
Q1 Q3 Q5 Q7 Q9 Q11 Q13 Q15 Q17 Q19 Q21 Q23 Q25 Q27 Q29 = 2N1069
Q2 Q4 Q6 Q8 Q10 Q12 Q14 Q16 Q18 Q20 Q22 Q24 Q26 Q28 Q30 = 2N1132A
Q31 = 2N1069_0
Q32 = 2N1132A_1
R4-R124 = R
U1#1 = 168KT2b_23
U1#2 U2#2 U3-U7 U8#1 U9-U11 U12#2 = 168KT2b_2
U2#1 = 168KT2b_24
U8#2 = 168KT2b_20
U12#1 = 168KT2b_22
U14 U15 U19-U34 = 140YD1B_0
U16#1 = 168KT2b_25
U16#2 = 168KT2b_21
U16#3 U17#1 U18 = 168KT2b_19
U17#2 = 168KT2b_26
* = TitleBlock0: Page Create Date: March  8, 1995; Page Count: 1